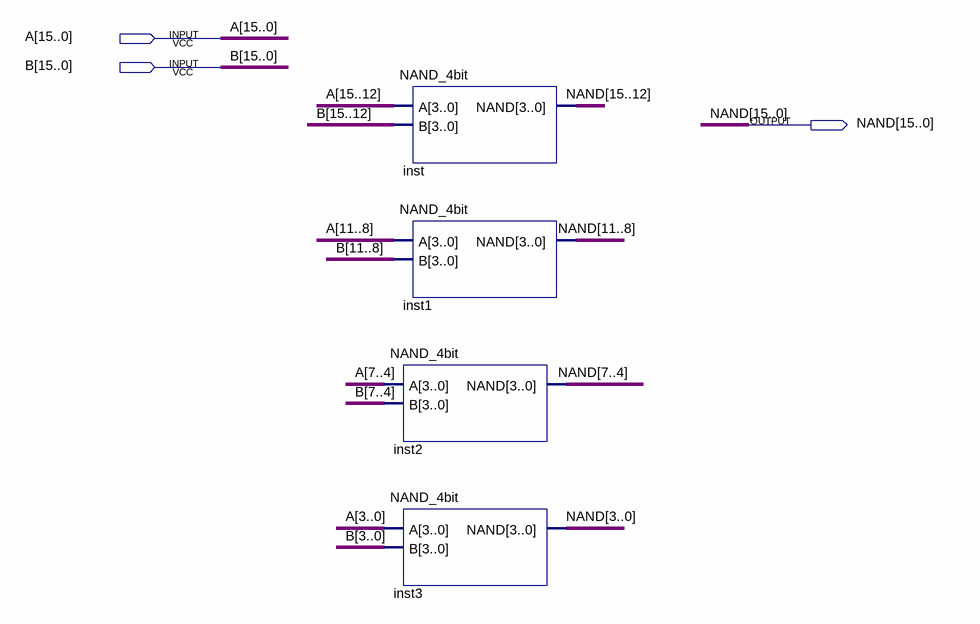
[diagram p0: schematic sheet]
// Quartus schematic NAND_16bit.bdf as structural Verilog: 4 symbols, 3 pins
module NAND_16bit (
  input  [15:0] A,
  input  [15:0] B,
  output [15:0] NAND
);

  NAND_4bit inst (.A(A[15:12]), .B(B[15:12]), .NAND(NAND[15:12]));
  NAND_4bit inst1 (.A(A[11:8]), .B(B[11:8]), .NAND(NAND[11:8]));
  NAND_4bit inst2 (.A(A[7:4]), .B(B[7:4]), .NAND(NAND[7:4]));
  NAND_4bit inst3 (.A(A[3:0]), .B(B[3:0]), .NAND(NAND[3:0]));
endmodule
